# EAGLE board esp32_servo_lcd_cam_v6 (EAGLE 9.7.0), part 1 of 2
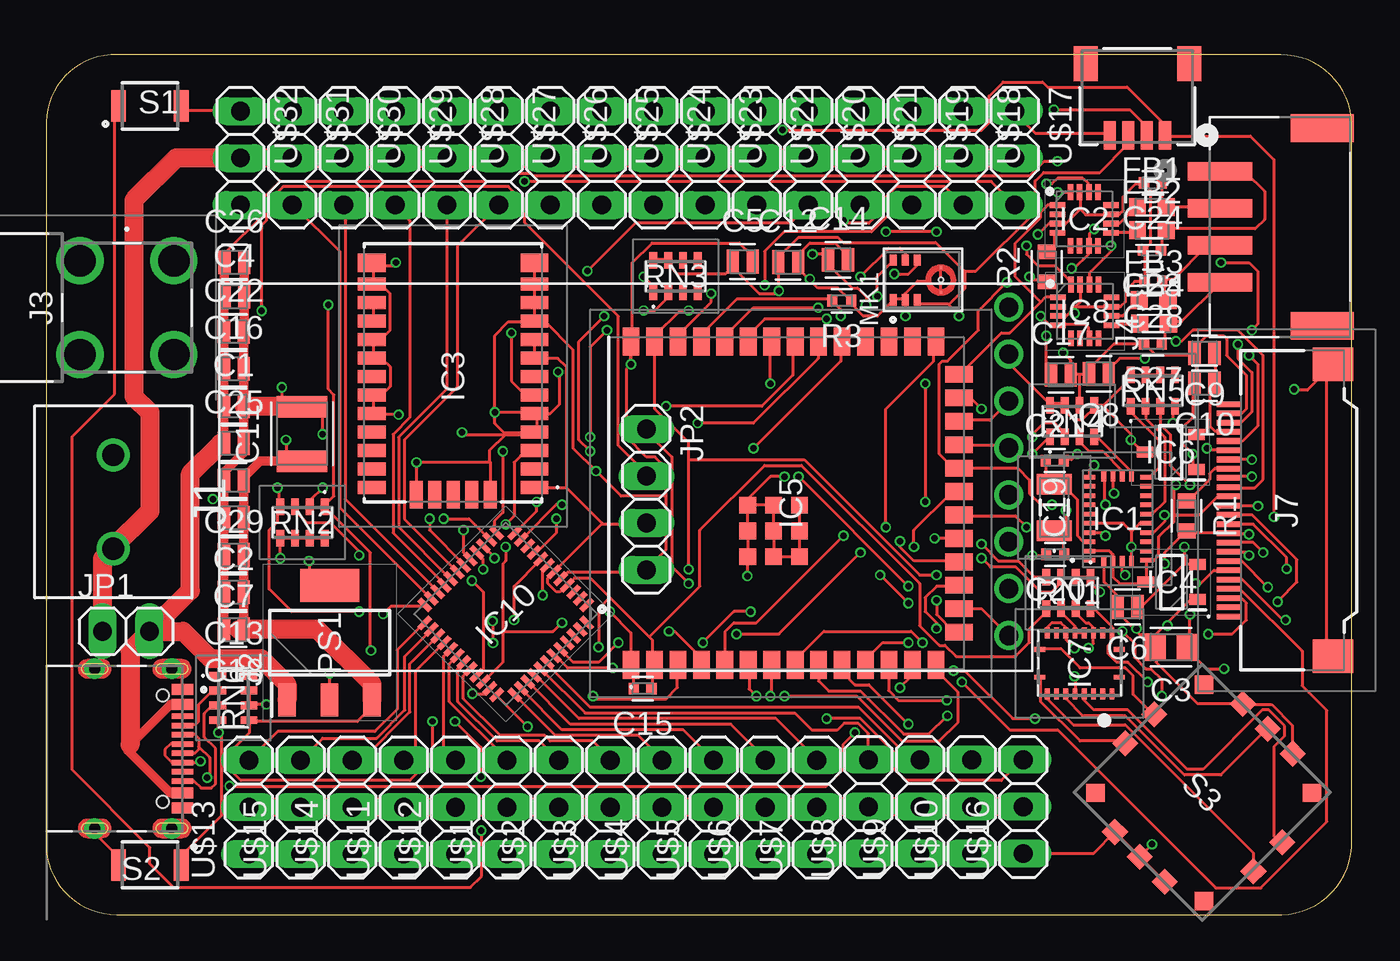
[diagram p2: board, top side]
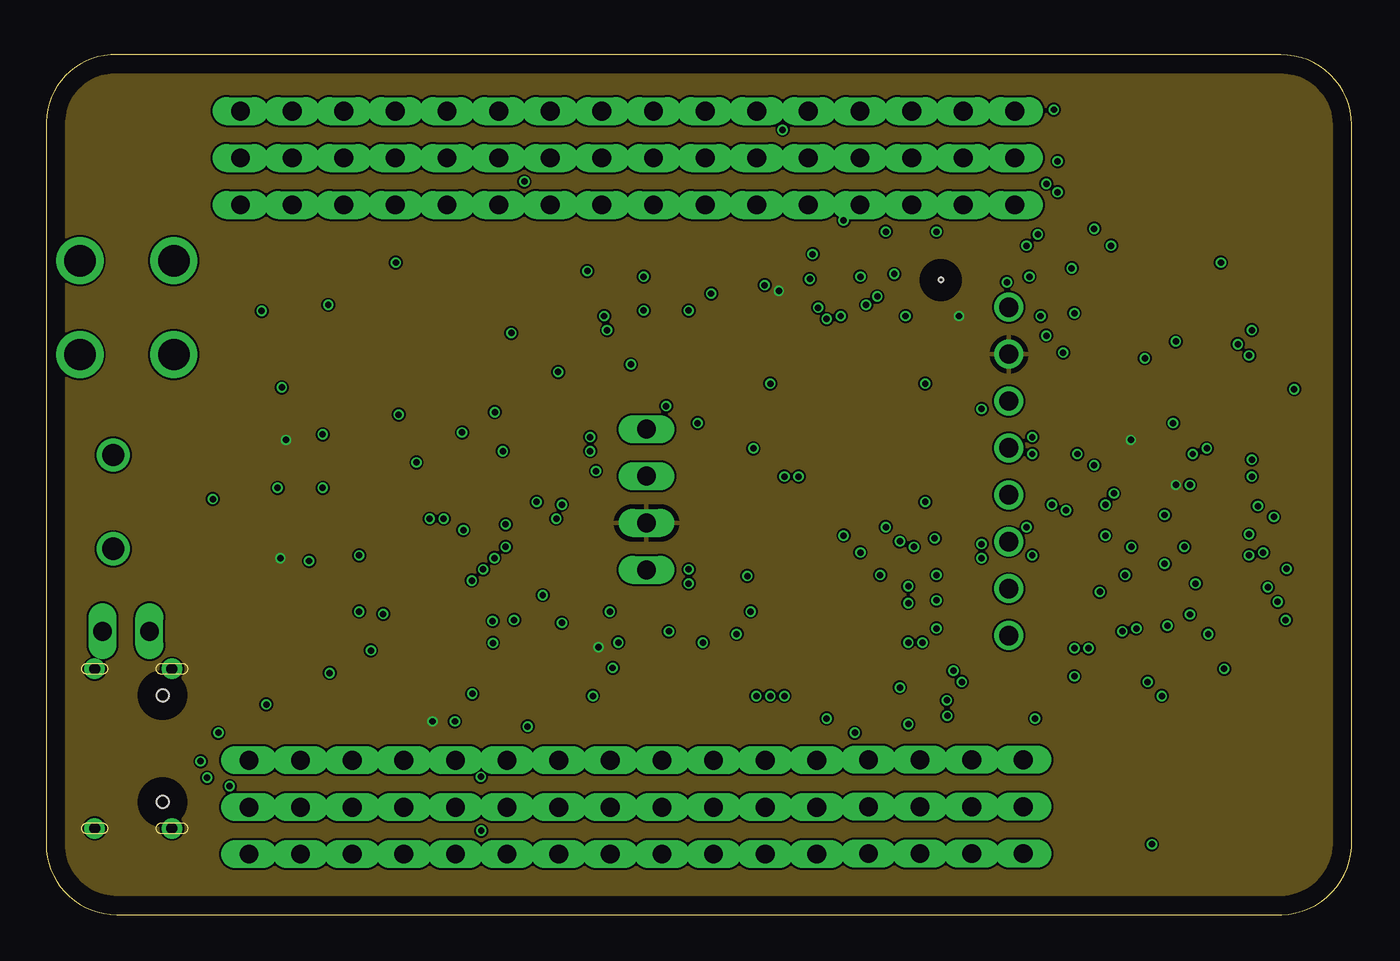
[diagram p3: board, inner layer Route2]
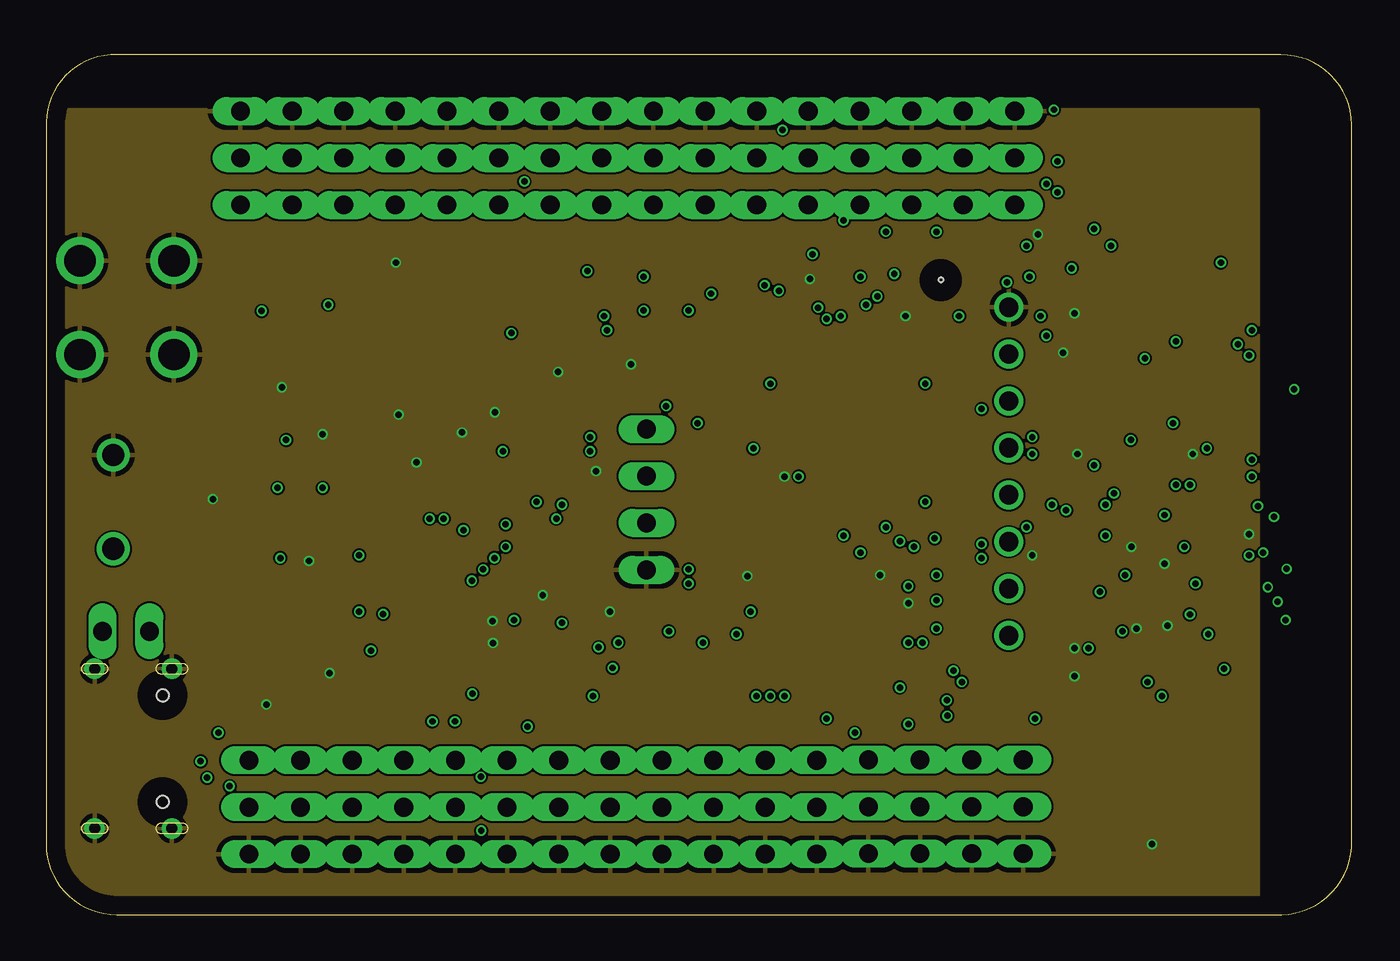
[diagram p4: board, inner layer Route15]
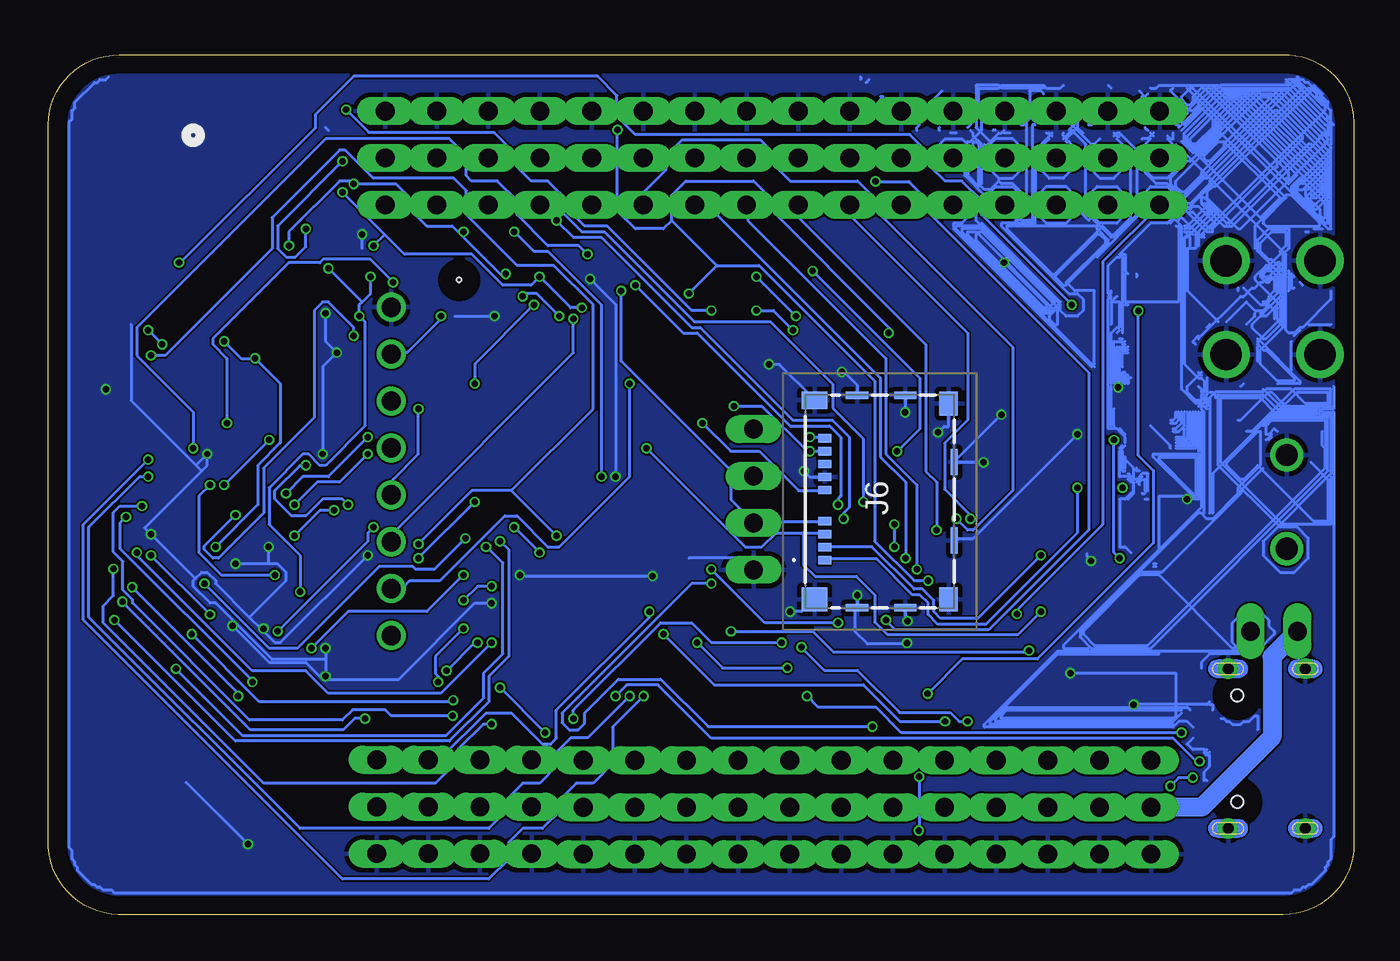
[diagram p5: board, bottom side, seen from below]

Size 70.66 x 46.56 mm. Coordinates in mm from the lower left corner, seen from the top.
Outline: 3.82,0 66.87,0 arc90 70.66,4.02 70.66,42.77 arc90 66.8,46.56 3.82,46.56 arc90 0,42.93 0,3.82 arc90 3.82,0
Copper layers (1*16): Top 0.035mm / dielectric 1.5mm / Bottom 0.035mm
Design rules "Fusion Electronics Design Rules *": minimum track width 3mil, minimum drill 0.35mm, track to track 4mil, track to pad 4mil, pad to pad 4mil, via to via 4mil, smd to smd 4mil, copper to edge 40mil, drill to drill 6mil, minimum pad ring 10mil, minimum via ring 4mil, stop-mask expansion 4mil, vias tented up to drill 9999mil, thermal gap 10mil

## Footprints (pad centres in the part's own frame; a part is rotated, then mirrored left to right if it is on the bottom)
CAPC1110X102 = smd 0.663 x 1.282: 1 -0.539,0; 2 0.539,0
CAPC2012X110 = smd 1.165 x 1.465: 1 -0.875,0; 2 0.875,0
CAPC3225X135 = smd 1.165 x 2.715: 1 -1.475,0; 2 1.475,0
CAPC1005X60 = smd 0.56 x 0.629: 1 -0.485,0; 2 0.485,0
830009706 = smd 1.1 x 1.9: 1 -1.25,0; 2 1.25,0
BEADC1608X95N = smd 0.9 x 0.97: 1 -0.785,0 | smd 0.933 x 0.97: 2 0.769,0
BNO085 = smd 0.675 x 0.25: 1 1.563,2.25; 6 -1.563,2.25; 7 -1.563,1.75; 8 -1.563,1.25; 9 -1.563,0.75; 10 -1.563,0.25; 11 -1.563,-0.25; 12 -1.563,-0.75; 13 -1.563,-1.25; 14 -1.563,-1.75; 15 -1.563,-2.25; 20 1.563,-2.25; 21 1.563,-1.75; 22 1.563,-1.25; 23 1.563,-0.75; 24 1.563,-0.25; 25 1.563,0.25; 26 1.563,0.75; 27 1.563,1.25; 28 1.563,1.75 | smd 0.25 x 0.575: 2 0.75,2.313; 3 0.25,2.313; 4 -0.25,2.313; 5 -0.75,2.313; 16 -0.75,-2.313; 17 -0.25,-2.313; 18 0.25,-2.313; 19 0.75,-2.313
QFN50P300X300X80-17N = smd 0.85 x 0.3: 1 -1.45,0.75; 2 -1.45,0.25; 3 -1.45,-0.25; 4 -1.45,-0.75; 9 1.45,-0.75; 10 1.45,-0.25; 11 1.45,0.25; 12 1.45,0.75 | smd 0.3 x 0.85: 5 -0.75,-1.45; 6 -0.25,-1.45; 7 0.25,-1.45; 8 0.75,-1.45; 13 0.75,1.45; 14 0.25,1.45; 15 -0.25,1.45; 16 -0.75,1.45
CAMM8Q0 = smd 0.7 x 1.5: 1 -6.2,-4.4; 2 -5.2,-4.4; 3 -4.2,-4.4; 4 -3.2,-4.4; 5 -2.2,-4.4; 6 -1.2,-4.4; 7 -0.2,-4.4; 8 0.8,-4.4; 9 1.8,-4.4; 10 2.8,-4.4; 11 3.8,-4.4; 12 4.8,-4.4; 15 4.8,4.4; 16 3.8,4.4; 17 2.8,4.4; 18 1.8,4.4; 19 0.8,4.4; 20 -0.2,4.4; 21 -1.2,4.4; 22 -2.2,4.4; 23 -3.2,4.4; 24 -4.2,4.4; 25 -5.2,4.4; 26 -6.2,4.4 | smd 1 x 1.5: 13 5.95,-4.4; 14 5.95,4.4 | smd 1.5 x 0.7: 27 -6.6,2; 28 -6.6,1; 29 -6.6,0; 30 -6.6,-1; 31 -6.6,-2
SOT95P280X130-3N = smd 0.9 x 0.6: 1 -1.4,0.95; 2 -1.4,-0.95; 3 1.4,0
ESP32S3WROOM1UN16R8 = smd 1.5 x 0.9: 1 -8.75,8.41; 2 -8.75,7.14; 3 -8.75,5.87; 4 -8.75,4.6; 5 -8.75,3.33; 6 -8.75,2.06; 7 -8.75,0.79; 8 -8.75,-0.48; 9 -8.75,-1.75; 10 -8.75,-3.02; 11 -8.75,-4.29; 12 -8.75,-5.56; 13 -8.75,-6.83; 14 -8.75,-8.1; 27 8.75,-8.1; 28 8.75,-6.83; 29 8.75,-5.56; 30 8.75,-4.29; 31 8.75,-3.02; 32 8.75,-1.75; 33 8.75,-0.48; 34 8.75,0.79; 35 8.75,2.06; 36 8.75,3.33; 37 8.75,4.6; 38 8.75,5.87; 39 8.75,7.14; 40 8.75,8.41 | smd 0.9 x 1.5: 15 -6.985,-9.35; 16 -5.715,-9.35; 17 -4.445,-9.35; 18 -3.175,-9.35; 19 -1.905,-9.35; 20 -0.635,-9.35; 21 0.635,-9.35; 22 1.905,-9.35; 23 3.175,-9.35; 24 4.445,-9.35; 25 5.715,-9.35; 26 6.985,-9.35 | smd 0.9 x 0.9: 41 -1.5,0.69; 42 -1.5,2.09; 43 -2.9,2.09; 44 -2.9,0.69; 45 -2.9,-0.71; 46 -1.5,-0.71; 47 -0.1,-0.71; 48 -0.1,0.69; 49 -0.1,2.09
SN74CB3Q3244RGYR = smd 0.25 x 0.6: 1 -0.75,2.15; 10 -0.75,-2.15; 11 0.75,-2.15; 20 0.75,2.15 | smd 0.6 x 0.25: 2 -1.65,1.75; 3 -1.65,1.25; 4 -1.65,0.75; 5 -1.65,0.25; 6 -1.65,-0.25; 7 -1.65,-0.75; 8 -1.65,-1.25; 9 -1.65,-1.75; 12 1.65,-1.75; 13 1.65,-1.25; 14 1.65,-0.75; 15 1.65,-0.25; 16 1.65,0.25; 17 1.65,0.75; 18 1.65,1.25; 19 1.65,1.75
QFN50P700X700X65-49N = smd 0.85 x 0.3: 1 -3.45,2.75; 2 -3.45,2.25; 3 -3.45,1.75; 4 -3.45,1.25; 5 -3.45,0.75; 6 -3.45,0.25; 7 -3.45,-0.25; 8 -3.45,-0.75; 9 -3.45,-1.25; 10 -3.45,-1.75; 11 -3.45,-2.25; 12 -3.45,-2.75; 25 3.45,-2.75; 26 3.45,-2.25; 27 3.45,-1.75; 28 3.45,-1.25; 29 3.45,-0.75; 30 3.45,-0.25; 31 3.45,0.25; 32 3.45,0.75; 33 3.45,1.25; 34 3.45,1.75; 35 3.45,2.25; 36 3.45,2.75 | smd 0.3 x 0.85: 13 -2.75,-3.45; 14 -2.25,-3.45; 15 -1.75,-3.45; 16 -1.25,-3.45; 17 -0.75,-3.45; 18 -0.25,-3.45; 19 0.25,-3.45; 20 0.75,-3.45; 21 1.25,-3.45; 22 1.75,-3.45; 23 2.25,-3.45; 24 2.75,-3.45; 37 2.75,3.45; 38 2.25,3.45; 39 1.75,3.45; 40 1.25,3.45; 41 0.75,3.45; 42 0.25,3.45; 43 -0.25,3.45; 44 -0.75,3.45; 45 -1.25,3.45; 46 -1.75,3.45; 47 -2.25,3.45; 48 -2.75,3.45
TERMBLK_508-2N = drill 1.2: 1 0,0; 2 5.08,0
SAMESKY_UJ20-C-H-G-SMT-1-P16-TR = smd 0.6 x 1.15: A1_B12 -3.2,7.345; A4_B9 -2.4,7.345; B1_A12 3.2,7.345; B4_A9 2.4,7.345 | smd 0.3 x 1.15: A5 -1.25,7.345; A6 -0.25,7.345; A7 0.25,7.345; A8 1.25,7.345; B5 1.75,7.345; B6 0.75,7.345; B7 -0.75,7.345; B8 -1.75,7.345 | drill 0.6 pad 1: SH1 -4.32,6.78; SH2 4.32,6.78; SH3 -4.32,2.6; SH4 4.32,2.6 | hole 0.65: -2.89,6.28; 2.89,6.28
132135RP = drill 1.7 pad 2.55: 2 2.54,2.54; 3 -2.54,2.54; 4 -2.54,-2.54; 5 2.54,-2.54
JST_S4B-PH-SM4-TB = smd 1 x 3.5: 1 -3,2.75; 2 -1,2.75; 3 1,2.75; 4 3,2.75 | smd 1.5 x 3.4: SH1 -5.35,-2.8; SH2 5.35,-2.8
CONN_SM04B-SRSS-TB_JST = smd 0.66 x 1.549: 1 1.5,-2.099; 2 0.5,-2.099; 3 -0.5,-2.099; 4 -1.5,-2.099 | smd 1.295 x 1.905: 5 -2.8,1.776; 6 2.8,1.776
MEM20850011500A = smd 0.45 x 0.7: CD1 -2.02,-2.99; P1 3.18,-2.99; P2 2.48,-2.99; P3 1.78,-2.99; P4 1.08,-2.99; P5 -0.62,-2.99; P6 -1.32,-2.99; P7 -2.72,-2.99; P8 -3.42,-2.99 | smd 1.3 x 1.4: G1 5.3,-3.53 | smd 0.95 x 1.4: G2 -5.475,-3.53 | smd 0.4 x 1.2: G3 5.75,-1.23; G4 -5.75,-1.23; G5 5.75,1.37; G6 -5.75,1.37 | smd 1.3 x 1: G7 5.3,3.73; G10 -5.3,3.73 | smd 1.4 x 0.4: G8 2.11,4.03; G9 -2.14,4.03
F31L1A7H111024 = smd 0.3 x 1.3: 1 -5.75,3.135; 2 -5.25,3.135; 3 -4.75,3.135; 4 -4.25,3.135; 5 -3.75,3.135; 6 -3.25,3.135; 7 -2.75,3.135; 8 -2.25,3.135; 9 -1.75,3.135; 10 -1.25,3.135; 11 -0.75,3.135; 12 -0.25,3.135; 13 0.25,3.135; 14 0.75,3.135; 15 1.25,3.135; 16 1.75,3.135; 17 2.25,3.135; 18 2.75,3.135; 19 3.25,3.135; 20 3.75,3.135; 21 4.25,3.135; 22 4.75,3.135; 23 5.25,3.135; 24 5.75,3.135 | smd 1.8 x 2.2: MP1 -7.9,-2.515; MP2 7.9,-2.515
1X02 = drill 1.016 long: 1 -1.27,0; 2 1.27,0
1X04 = drill 1.016 long: 1 -3.81,0; 2 -1.27,0; 3 1.27,0; 4 3.81,0
MIC_DMM-4026-B-I2S-R = smd 0.6 x 0.4: 1 -1.075,1.58; 2 -1.075,0.93; 3 -1.075,0.28; 5 1.075,0.28; 6 1.075,0.93; 7 1.075,1.58 | smd 0.15 x 0.15: 4_1 -0.675,-1; 4_2 0.675,-1 | hole 0.25: 0,-1
SOT230P700X180-4N = smd 1.8 x 0.95: 1 -3.1,2.3; 2 -3.1,0; 3 -3.1,-2.3 | smd 1.8 x 3.2: 4 3.1,0
RESC1608X60 = smd 0.799 x 0.974: 1 -0.815,0; 2 0.815,0
RESC1005X40 = smd 0.535 x 0.644: 1 -0.507,0; 2 0.507,0
CAY16151J4LF = smd 0.425 x 0.9: 1 -1.2,-0.85; 2 -0.4,-0.85; 3 0.4,-0.85; 4 1.2,-0.85; 5 1.2,0.85; 6 0.4,0.85; 7 -0.4,0.85; 8 -1.2,0.85
B3U-1000P = smd 0.8 x 1.7: 1 1.7,0; 2 -1.7,0
JS1300 = smd 1 x 1: 1 -4.813,-1.06; 2 4.987,-1.06; 3 4.987,1.14; 4 -4.813,1.14; 5 -1.813,4.94; 6 0.087,4.94; 7 1.987,4.94; 8 -1.813,-4.86; 9 0.087,-4.86; 10 1.987,-4.86 | smd 1 x 1 rotated 135: 11 4.224,-4.097; 13 -4.05,4.177 | smd 1 x 1 rotated 45: 12 4.224,4.177; 14 -4.05,-4.097
1X03 = drill 1.016 long: 1 -2.54,0; 2 0,0; 3 2.54,0
1.47_IN_TFT_172_320_ST7789P3 = drill 1.05: P$1 1.27,19.05; P$2 1.27,16.51; P$3 1.27,13.97; P$4 1.27,11.43; P$5 1.27,8.89; P$6 1.27,6.35; P$7 1.27,3.81; P$8 1.27,1.27

## Placement (x,y rotation side)
C1  .1uF  [CAPC1110X102]  10.16,27.54 0 top
C2  10uF  [CAPC1110X102]  10.16,21.49 180 top
C3  15pF  [CAPC2012X110]  60.88,14.48 180 top
C4  10uF  [CAPC1110X102]  10.19,33.45 0 top
C5  .1uF  [CAPC1110X102]  37.69,35.36 0 top
C6  .1uF  [CAPC1110X102]  58.52,16.66 180 top
C7  .1uF  [CAPC1110X102]  10.16,19.48 180 top
C8  10uF  [CAPC1110X102]  56.97,29.29 180 top
C9  10uF  [CAPC1110X102]  62.69,30.4 180 top
C10  .1uF  [CAPC1110X102]  62.69,28.78 180 top
C11  100uF  [CAPC3225X135]  13.84,26.04 90 top
C12  .1uF  [CAPC1110X102]  40.16,35.33 0 top
C13  10uF  [CAPC1110X102]  10.16,17.46 180 top
C14  .1uF  [CAPC1110X102]  42.85,35.46 0 top
C15  4.7uF  [CAPC1005X60]  32.28,12.24 180 top
C16  .1uF  [CAPC1110X102]  10.16,29.56 0 top
C17  .1uF  [CAPC1110X102]  54.91,29.24 0 top
C18  .1uF  [CAPC1110X102]  10.16,15.44 180 top
C19  830009706  [830009706]  54.56,22.05 90 top
C20  22pF  [CAPC1005X60]  54.61,19.51 180 top
C21  22pF  [CAPC1005X60]  54.58,24.59 0 top
C22  10uF  [CAPC1110X102]  10.16,31.57 0 top
C23  220pF  [CAPC1005X60]  59.84,35.99 180 top
C24  220pF  [CAPC1005X60]  59.89,39.62 180 top
C25  .1uF  [CAPC1110X102]  10.16,25.52 0 top
C26  10uF  [CAPC1110X102]  10.19,35.32 0 top
C27  220pF  [CAPC1005X60]  59.89,30.91 180 top
C28  220pF  [CAPC1005X60]  59.92,34.29 180 top
C29  .1uF  [CAPC1110X102]  10.16,23.51 180 top
FB1  LM18AG601  [BEADC1608X95N]  59.84,38.3 0 top
FB2  LM18AG601  [BEADC1608X95N]  59.84,37.06 0 top
FB3  LM18AG601  [BEADC1608X95N]  59.94,33.27 0 top
FB4  LM18AG601  [BEADC1608X95N]  59.97,32 0 top
IC1  BNO085  [BNO085]  57.99,21.44 180 top
IC2  MAX98357AETE+T  [QFN50P300X300X80-17N]  56.18,37.67 0 top
IC3  CAM-M8Q-0  [CAMM8Q0]  22.02,29.34 90 top
IC4  XC6206P122MR-G  [SOT95P280X130-3N]  60.91,18.01 180 top
IC5  ESP32-S3-WROOM-1U-N16R8  [ESP32S3WROOM1UN16R8]  40.06,22.28 90 top
IC6  XC6206P282MR-G  [SOT95P280X130-3N]  60.86,25.04 180 top
IC7  PCF8574RGYR  [SN74CB3Q3244RGYR]  55.93,13.61 270 top
IC8  MAX98357AETE+T  [QFN50P300X300X80-17N]  56.21,32.66 0 top
IC10  STM32G071C8U6TR  [QFN50P700X700X65-49N]  24.87,16.28 225 top
J1  TERM-BLK-2P  [TERMBLK_508-2N]  3.63,19.81 90 top
J2  UJ20-C-H-G-SMT-1-P16-TR  [SAMESKY_UJ20-C-H-G-SMT-1-P16-TR]  0.03,8.99 270 top
J3  132135RP  [132135RP]  4.37,32.87 90 top
J4  S4B-PH-SM4-TB  [JST_S4B-PH-SM4-TB]  66.27,37.24 90 top
J5  SM04B-SRSS-TBCONN_SM04B-SRSS-TB_JST  [CONN_SM04B-SRSS-TB_JST]  59.05,44.3 0 top
J6  MEM2085-00-115-00-A  [MEM20850011500A]  25.65,22.38 270 bottom
J7  F31L-1A7H1-11024  [F31L1A7H111024]  67.13,21.89 90 top
JP1  PINHD-1X2  [1X02]  4.32,15.34 0 top
JP2  PINHD-1X4  [1X04]  32.49,22.48 270 top
MK1  DMM-4026-B-I2S-R  [MIC_DMM-4026-B-I2S-R]  47.42,34.37 90 top
PS1  TL1963A-33DCYR  [SOT230P700X180-4N]  15.34,14.73 90 top
R1  1K  [RESC1608X60]  61.72,21.59 270 top
R2  370K  [RESC1608X60]  54.15,35.08 90 top
R3  100K  [RESC1005X40]  43.05,33.25 180 top
RN1  CAY16-103J4LF  [CAY16151J4LF]  55.32,17.42 180 top
RN2  CAY16-103J4LF  [CAY16151J4LF]  13.87,21.23 180 top
RN3  CAY16-103J4LF  [CAY16151J4LF]  34.06,34.57 0 top
RN4  CAY16-103J4LF  [CAY16151J4LF]  55.52,26.72 0 top
RN5  CAY16-103J4LF  [CAY16151J4LF]  59.89,28.37 0 top
RN6  CAY16-103J4LF  [CAY16151J4LF]  10.13,11.73 270 top
S1  B3U-1000P  [B3U-1000P]  5.61,43.79 180 top
S2  B3U-1000P  [B3U-1000P]  5.61,2.69 0 top
S3  JS1300AQ  [JS1300]  62.56,6.63 315 top
U$1  Servo 6  [1X03]  24.94,5.82 90 top
U$2  Servo 7  [1X03]  27.74,5.82 90 top
U$3  Servo 8  [1X03]  30.53,5.82 90 top
U$4  Servo 9  [1X03]  33.32,5.82 90 top
U$5  Servo 10  [1X03]  36.12,5.82 90 top
U$6  Servo 11  [1X03]  38.91,5.82 90 top
U$7  Servo 12  [1X03]  41.71,5.82 90 top
U$8  Servo 13  [1X03]  44.5,5.84 90 top
U$9  Servo 14  [1X03]  47.29,5.84 90 top
U$10  Servo 15  [1X03]  50.09,5.84 90 top
U$11  Servo 4  [1X03]  19.35,5.82 90 top
U$12  Servo 5  [1X03]  22.15,5.82 90 top
U$13  Servo 1  [1X03]  10.97,5.82 90 top
U$14  Servo 3  [1X03]  16.56,5.82 90 top
U$15  Servo 2  [1X03]  13.77,5.82 90 top
U$16  Servo 16  [1X03]  52.88,5.84 90 top
U$17  Servo 17  [1X03]  52.43,40.97 270 top
U$18  Servo 18  [1X03]  49.63,40.97 270 top
U$19  Servo 19  [1X03]  46.84,40.97 270 top
U$20  Servo 21  [1X03]  41.25,40.97 270 top
U$21  Servo 20  [1X03]  44.04,40.97 270 top
U$22  Servo 22  [1X03]  38.46,40.97 270 top
U$23  Servo 23  [1X03]  35.66,40.97 270 top
U$24  Servo 24  [1X03]  32.87,40.97 270 top
U$25  Servo 25  [1X03]  30.07,40.97 270 top
U$26  Servo 26  [1X03]  27.28,40.97 270 top
U$27  Servo 27  [1X03]  24.49,40.97 270 top
U$28  Servo 28  [1X03]  21.69,40.97 270 top
U$29  Servo 29  [1X03]  18.9,40.97 270 top
U$30  Servo 30  [1X03]  16.1,40.97 270 top
U$31  Servo 31  [1X03]  13.31,40.97 270 top
U$32  Servo 32  [1X03]  10.52,40.97 270 top
U$33  1.47_IN_TFT_172_320_ST7789P3  [1.47_IN_TFT_172_320_ST7789P3]  53.37,34.16 180 top